# Altium schematic sheet Connector-Sheet.SchDoc
size 420 x 297 mm
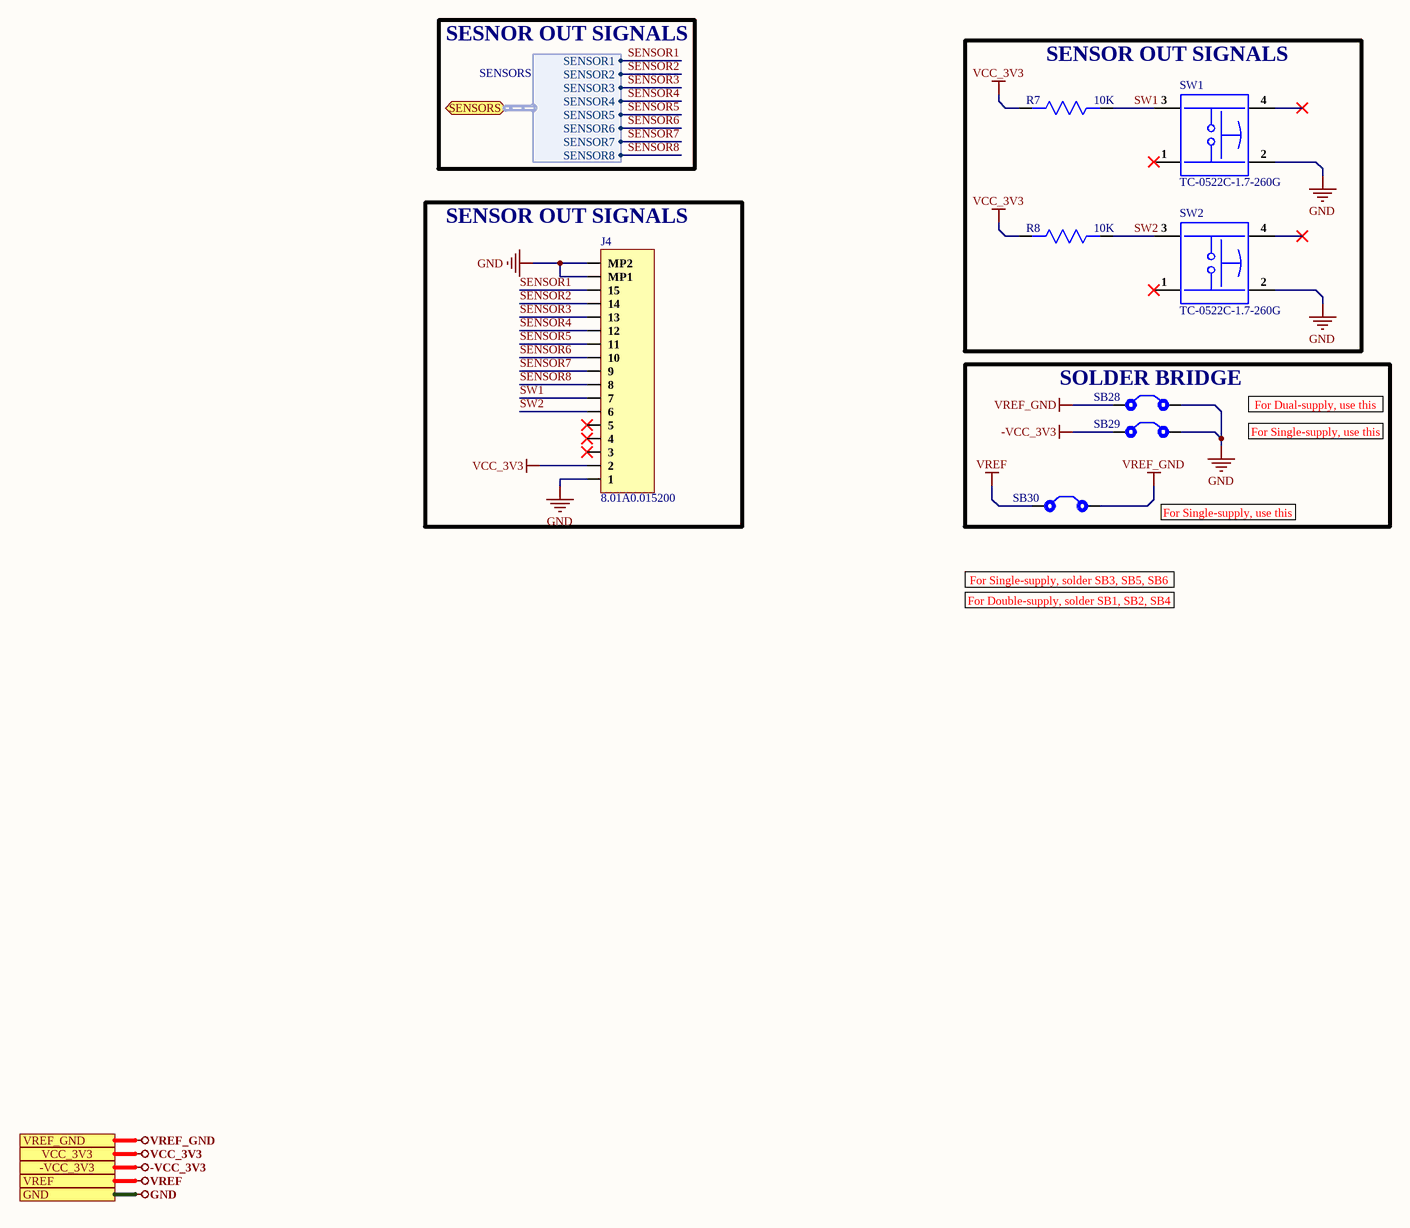
[diagram p0: Connector-Sheet.SchDoc]

## Parts
J4  8.01A0.015200  [8.01A0.015200]
R7  10K  [Res-0402]
R8  10K  [Res-0402]
SB28  Solder Bridge 0402  [Solder Bridge 0402]  (value not drawn)  (no BOM)
SB29  Solder Bridge 0402  [Solder Bridge 0402]  (value not drawn)  (no BOM)
SB30  Solder Bridge 0402  [Solder Bridge 0402]  (value not drawn)  (no BOM)
SW1  TC-0522C-1.7-260G  [TC-0522C-1.7-260G_]
SW2  TC-0522C-1.7-260G  [TC-0522C-1.7-260G_]

## Blocks framed on the sheet
SENSOR OUT SIGNALS: R7 R8 SW1 SW2
SENSOR OUT SIGNALS: J4
SOLDER BRIDGE: SB28-SB30

## Ports
-VCC_3V3, GND, SENSORS (bidir, harness SENSORS), VCC_3V3, VREF, VREF_GND

## Harnesses
SENSORS: SENSOR1, SENSOR2, SENSOR3, SENSOR4, SENSOR5, SENSOR6, SENSOR7, SENSOR8

## Nets
-VCC_3V3: SB29.1 ; port -VCC_3V3
GND: J4.1 J4.MP1 J4.MP2 SB28.2 SB29.2 SW1.2 SW2.2 ; port GND
VCC_3V3: J4.2 R7.2 R8.2 ; port VCC_3V3
VREF: SB30.1 ; port VREF
VREF_GND: SB28.1 SB30.2 ; port VREF_GND
SENSOR1: J4.15 ; port SENSORS.SENSOR1
SENSOR2: J4.14 ; port SENSORS.SENSOR2
SENSOR3: J4.13 ; port SENSORS.SENSOR3
SENSOR4: J4.12 ; port SENSORS.SENSOR4
SENSOR5: J4.11 ; port SENSORS.SENSOR5
SENSOR6: J4.10 ; port SENSORS.SENSOR6
SENSOR7: J4.9 ; port SENSORS.SENSOR7
SENSOR8: J4.8 ; port SENSORS.SENSOR8
SW1: J4.7 R7.1 SW1.3
SW2: J4.6 R8.1 SW2.3

Not connected (* = marked no-connect by the designer): J4 3* 4* 5*; SW1 1* 4*; SW2 1* 4*

## Notes on the sheet
- SESNOR OUT SIGNALS
- For Dual-supply, use this
- For Single-supply, use this
- For Single-supply, solder SB3, SB5, SB6
- For Double-supply, solder SB1, SB2, SB4
- File:
- Title:
- Date:
- Page
- Num:
- Total:
- Drawn By: Huzaifa Ali

## Library data of the parts
J4 = 8.01A0.015200: -40℃~+80℃ 15P Dual-sided contacts / top and bottom connection 0.5mm SMD,P=0.5mm,Surface Mount，Right Angle FFC, FPC (Flat Flexible) Connector Assemblies ROHS; Manufacturer: DIANWEI; Item Type: FFC, FPC Connector; Manufacturer Part Number: 8.01A0.015200; Package: SMD,P=0.5mm,Surface Mount，Right Angle; LCSC Part Number: C19188796; ComponentLink1Description: LCSC; ComponentLink1URL: https://www.lcsc.com/product-detail/FFC-FPC-Flat-Flexible-Connector-Assemblies_DIANWEI-8-01A0-015200_C19188796.html?s_z=n_HC-FPC-05-20-15RLTAG
R7 R8 = RC0402FR-0710KL: RES 10K OHM 1% 1/16W 0402; Manufacturer: Yageo; Resistance: 10kR; Temperature Coefficient: 100ppm/°C; Voltage Rating (DC): 50V; Power Rating: 62.5mW; Max Power Dissipation: 63mW; Supplier 1: Mouser; Manufacturer Part Number: RC0402FR-0710KL; Stock 1: 18648329; Pricing 1: 1=0.10000, 10=0.01400, 50=0.01400, 100=0.00500, 1000=0.00300, 10000=0.00200 (USD); Case/Package: 0402; Number of Pins: 2; Case Code (Imperial): 0402; Case Code (Metric): 1005; Min Operating Temperature: -55°C; Max Operating Temperature: 155°C; Tolerance: 1%; Packaging: Tape and Reel; Voltage Rating: 50V; Termination: SMD/SMT; Military Standard: Not; Working Voltage: 50V; Number of Terminations: 2; Length: 1mm; Height: 0.32mm; Width: 0.5mm; Depth: 0.5mm; Lead Pitch: 0.2mm; REACH SVHC: No SVHC; Lead Free: Lead Free; ComponentLink1URL: https://datasheet.ciiva.com/7660/38568-7660787.pdf?src-supplier=Element14; ComponentLink1Description: https://datasheet.ciiva.com/7660/38568-7660787.pdf?src-supplier=Element14; ComponentLink2URL: https://datasheet.ciiva.com/7849/1686128-7849814.pdf?src-supplier=Element14; ComponentLink2Description: https://datasheet.ciiva.com/7849/1686128-7849814.pdf?src-supplier=Element14; ComponentLink3URL: https://datasheet.ciiva.com/7983/1018594-7983486.pdf?src-supplier=Element14; ComponentLink3Description: https://datasheet.ciiva.com/7983/1018594-7983486.pdf?src-supplier=Element14; ComponentLink4URL: https://datasheet.ciiva.com/22747/1018594-22747512.pdf?src-supplier=Element14; ComponentLink4Description: https://datasheet.ciiva.com/22747/1018594-22747512.pdf?src-supplier=Element14; Supplier Part Number 1: 603-RC0402FR-0710KL; RoHS: Yes; Category: Chip SMD Resistors; Resistor Type: Thick Film; Features: Moisture Resistant; Series: RC; Resistance Tolerance: 1%; Construction: Rectangular; RoHS Compliant: Yes; ComponentLink5URL: https://datasheet.ciiva.com/12667/pyu-rc0402-51-rohs-l-6-r-12667067.pdf?src-supplier=Mouser; ComponentLink5Description: https://datasheet.ciiva.com/12667/pyu-rc0402-51-rohs-l-6-r-12667067.pdf?src-supplier=Mouser; ComponentLink6URL: https://datasheet.ciiva.com/7849/1784430-7849813.pdf?src-supplier=Element14; ComponentLink6Description: https://datasheet.ciiva.com/7849/1784430-7849813.pdf?src-supplier=Element14; ComponentLink7URL: https://datasheet.ciiva.com/7849/1784430-7849815.pdf?src-supplier=Element14; ComponentLink7Description: https://datasheet.ciiva.com/7849/1784430-7849815.pdf?src-supplier=Element14; LCSC Part Number: C60490
SB28-SB30 = Solder Bridge 0402: Solder Bridge ON; Manufacturer Part Number: Solder Bridge 0402; Item Type: Solder Bridge
SW1 SW2 = TC-0522C-1.7-260G: No Gull Wing 50mA 100MΩ 80000 260gf@±50gf 12V -25℃~+85℃ 1.7mm Golden Round Button Brick nogging SPST SMD Tactile Switches ROHS; Manufacturer: HCTL; Item Type: Switch; Manufacturer Part Number: TC-0522C-1.7-260G; Value: -; Footprint: Custom; ComponentLink1Description: LCSC; ComponentLink1URL: https://www.lcsc.com/product-detail/Tactile-Switches_HCTL-TC-0522C-1-7-260G_C2845290.html; LCSC Part Number: C2845290